# EAGLE design Robot_NI-alim (EAGLE 6.5.0)
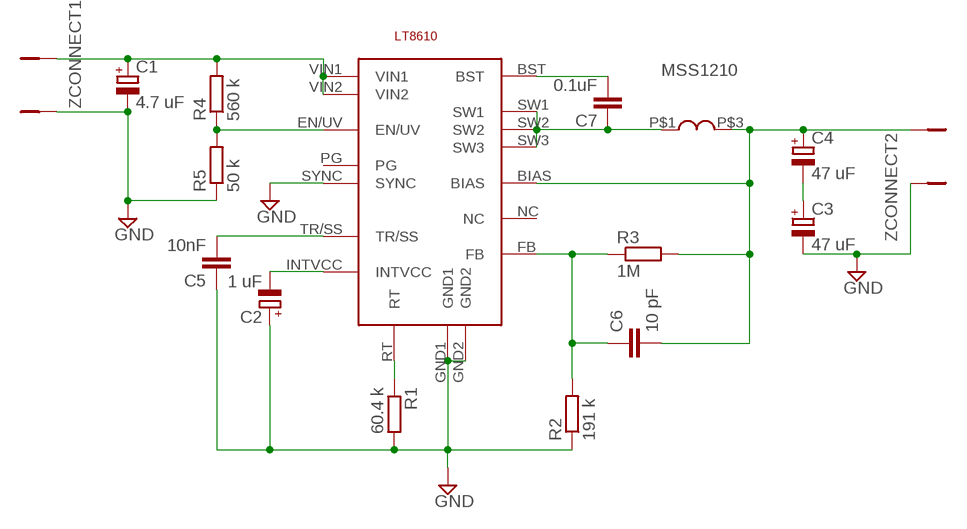
[diagram p0: schematic, sheet 1]

## Parts
C1  4.7 uF  C-POLTT5D7  [C-POL5MM]
C2  1 uF  C-POLTT5D7  [C-POL5MM]
C3  47 uF  C-POLTT5D7  [C-POL5MM]
C4  47 uF  C-POLTT5D7  [C-POL5MM]
C5  10nF  C-EUC0805  [C0805]
C6  10 pF  C-EUC0805  [C0805]
C7  0.1uF  C-EUC0805  [C0805]
R1  60.4 k  R-EU_R0805  [R0805]
R2  191 k  R-EU_R0805  [R0805]
R3  1M  R-EU_R0805  [R0805]
R4  560 k  R-EU_R0805  [R0805]
R5  50 k  R-EU_R0805  [R0805]
U$1  MSS1210  [MSS1210]
U$2  LT8610AC  [LT8610AC]
ZCONNECT1  LED5MM  [LED5MM]
ZCONNECT2  LED5MM  [LED5MM]

## Nets
GND: C1.- C2.+ C3.- C5.1 R1.2 R2.1 R5.1 U$2.GND1 U$2.GND2 U$2.SYNC ZCONNECT1.K(C) ZCONNECT2.A
N$1: C1.+ R4.2 U$2.VIN1 U$2.VIN2 ZCONNECT1.A
N$2: R4.1 R5.2 U$2.EN/UV
N$4: C5.2 U$2.TR/SS
N$5: C2.- U$2.INTVCC
N$6: C3.+ C4.-
N$7: R1.1 U$2.RT
N$9: C7.1 U$1.P$1 U$2.SW1 U$2.SW2 U$2.SW3
N$10: C7.2 U$2.BST
N$11: C4.+ C6.2 R3.2 U$1.P$3 U$2.BIAS ZCONNECT2.K(C)
N$12: C6.1 R2.2 R3.1 U$2.FB
Unconnected: U$2.NC U$2.PG

## Library data of the parts
C1-C4 = test3:C-POL: POLARIZED CAPACITOR, European symbol
C5-C7 = resistor:C-EU: CAPACITOR, European symbol
R1-R5 = rcl:R-EU_: RESISTOR, European symbol
U$1 = MSS1210:MSS1210
U$2 = lt8610ac:LT8610AC
ZCONNECT1 ZCONNECT2 = test3:LED: LED OSRAM: - CHIPLED LG R971, LG N971, LY N971, LG Q971, LY Q971, LO R971, LY R971 LH N974, LH R974 LS Q976, LO Q976, LY Q976 LO Q996 - Hyper CHIPLED LW Q18S LB Q993, LB Q99A, LB R99A - SideLED LS A670, LO A670, LY A670, LG A670, LP A670 LB A673, LV A673, LT A673, LW A673 LH A674 LY A675 LS A676, LA A676, LO A676, LY A676, LW A676 LS A679, LY A679, LG A679 - Hyper Micro SIDELED® LS Y876, LA Y876, LO Y876, LY Y876 LT Y87S - SmartLED LW L88C, LW L88S LB L89C, LB L89S, LG L890 LS L89K, LO L89K, LY L89K LS L896, LA L896, LO L896, LY L896 - TOPLED LS T670, LO T670, LY T670, LG T670, LP T670 LSG T670, LSP T670, LSY T670, LOP T670, LYG T670 LG T671, LOG T671, LSG T671 LB T673, LV T673, LT T673, LW T673 LH T674 LS T676, LA T676, LO T676, LY T676, LB T676, LH T676, LSB T676, LW T676 LB T67C, LV T67C, LT T67C, LS T67K, LO T67K, LY T67K, LW E67C LS E67B, LA E67B, LO E67B, LY E67B, LB E67C, LV E67C, LT E67C LW T67C LS T679, LY T679, LG T679 LS T770, LO T770, LY T770, LG T770, LP T770 LB T773, LV T773, LT T773, LW T773 LH T774 LS E675, LA E675, LY E675, LS T675 LS T776, LA T776, LO T776, LY T776, LB T776 LHGB T686 LT T68C, LB T68C - Hyper Mini TOPLED® LB M676 - Mini TOPLED Santana® LG M470 LS M47K, LO M47K, LY M47K Source: http://www.osram.convergy.de LUXEON: - LUMILED® LXK2-PW12-R00, LXK2-PW12-S00, LXK2-PW14-U00, LXK2-PW14-V00 LXK2-PM12-R00, LXK2-PM12-S00, LXK2-PM14-U00 LXK2-PE12-Q00, LXK2-PE12-R00, LXK2-PE12-S00, LXK2-PE14-T00, LXK2-PE14-U00 LXK2-PB12-K00, LXK2-PB12-L00, LXK2-PB12-M00, LXK2-PB14-N00, LXK2-PB14-P00, LXK2-PB14-Q00 LXK2-PR12-L00, LXK2-PR12-M00, LXK2-PR14-Q00, LXK2-PR14-R00 LXK2-PD12-Q00, LXK2-PD12-R00, LXK2-PD12-S00 LXK2-PH12-R00, LXK2-PH12-S00 LXK2-PL12-P00, LXK2-PL12-Q00, LXK2-PL12-R00 Source: www.luxeon.com KINGBRIGHT: KA-3528ASYC Source: www.kingbright.com

## Board
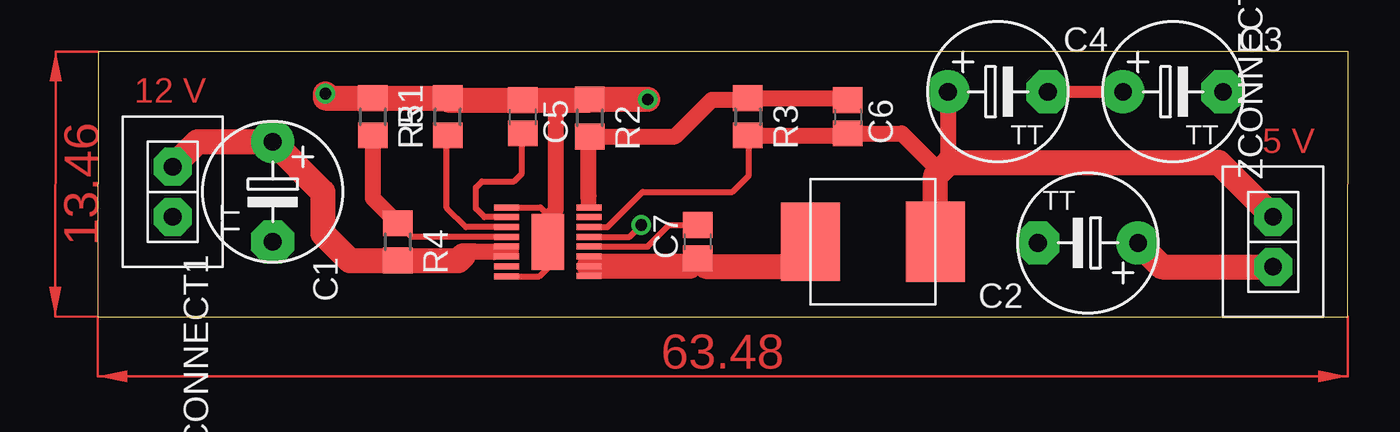
[diagram p1: board, top side]
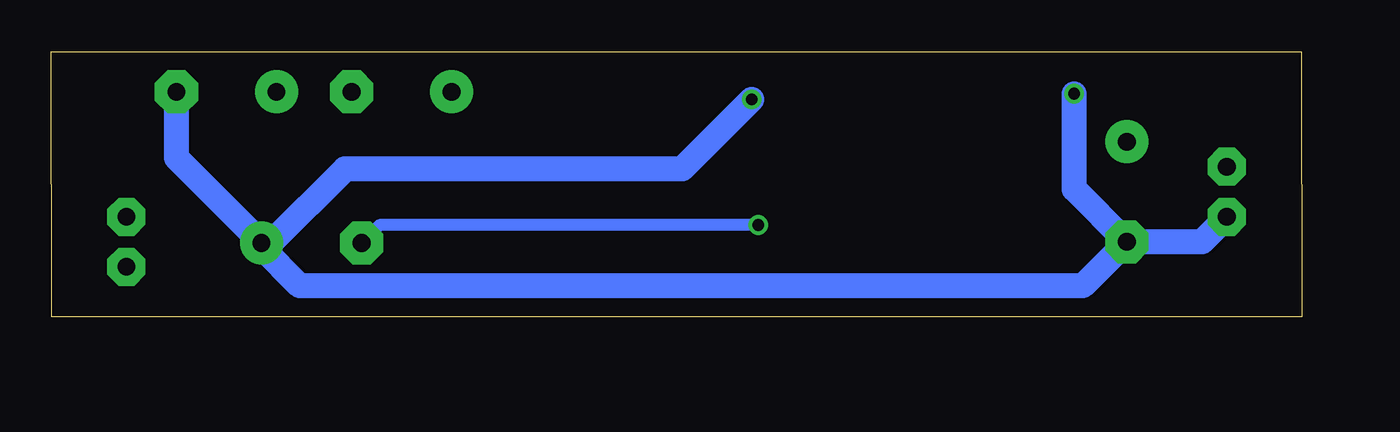
[diagram p2: board, bottom side, seen from below]

Size 63.52 x 13.46 mm. Coordinates in mm from the lower left corner, seen from the top.
Outline: 0,0 63.48,0 63.52,13.46 0.04,13.46 0,0
Copper layers (1*16): Top 0.035mm / dielectric 1.5mm / Bottom 0.035mm
Design rules "default": minimum track width 10mil, minimum drill 24mil, track to track 8mil, track to pad 8mil, pad to pad 8mil, via to via 8mil, smd to smd 8mil, copper to edge 40mil, drill to drill 8mil, minimum pad ring 10mil, minimum via ring 8mil, stop-mask expansion 4mil, vias tented up to drill 0mil, thermal gap 10mil

### Footprints (pad centres in the part's own frame; a part is rotated, then mirrored left to right if it is on the bottom)
C-POL5MM = drill 0.9 pad 2.184: + -2.54,0 | drill 0.9 pad 2.184 octagon: - 2.54,0
C0805 = smd 1.3 x 1.5: 1 -0.85,0; 2 0.85,0
R0805 = smd 1.3 x 1.5: 1 -0.95,0; 2 0.95,0
MSS1210 = smd 3 x 4: P$1 -3.175,0 | smd 3 x 4.08: P$3 3.175,0
LT8610AC = smd 1.27 x 0.305: BIAS 2.105,0.75; BST 2.105,-0.25; EN/UV -2.105,0.25; FB 2.105,1.75; GND1 -2.105,-1.75; INTVCC 2.105,0.25; NC -2.105,-1.25; PG 2.105,1.25; RT -2.105,0.75; SW1 2.105,-0.75; SW2 2.105,-1.25; SW3 2.105,-1.745; SYNC -2.105,1.75; TR/SS -2.105,1.25; VIN1 -2.105,-0.25; VIN2 -2.105,-0.75 | smd 1.651 x 2.845: GND2 0,0
LED5MM = drill 0.9 pad 1.93 octagon: A -1.27,0; K 1.27,0

### Placement (x,y rotation side)
C1  8.89,6.35 270 top
C2  50.29,3.75 180 top
C3  54.61,11.43 0 top
C4  45.72,11.43 0 top
C5  21.59,10.16 270 top
C6  38.1,10.16 270 top
C7  30.48,3.81 90 top
R1  17.78,10.16 90 top
R2  24.99,10.11 270 top
R3  33.02,10.16 270 top
R4  15.24,3.81 270 top
R5  13.97,10.16 270 top
U$1  39.37,3.81 0 top
U$2  22.86,3.81 0 top
ZCONNECT1  3.81,6.35 270 top
ZCONNECT2  59.69,3.81 90 top

### Tracks (layer width: path | path; a pad name or v marks a point on that pad's centre or on a via)
GND  (via drill 0.6)
  Top 0.305: U$2.SYNC 22.48,5.56 22.82,5.22 22.82,4.96 22.82,3.85 U$2.GND2 22.99,3.68 22.99,2.62 22.43,2.06 U$2.GND1
  Top 0.813: 25.07,11.06 23.6,11.06 23.25,10.71 23.25,5.38 22.82,4.96
  Top 1.27: C2.+ 54.04,2.54 ZCONNECT2.A | v11.56,11.33 11.56,11.11 R5.1 R1.2 17.78,11.01 C5.1 25.02,11.01 25.07,11.06 | R2.1 v27.93,11.05
  Bottom 1.27: C2.+ 57.15,8.07 C3.- | ZCONNECT1.K 5.08,3.81 C1.- | C1.- 11.12,1.57 50.88,1.57 52.83,3.52 C2.+ | C1.- 11.56,6.49 v11.56,11.33 | v27.93,11.05 31.48,7.51 48.59,7.51 52.35,3.75 C2.+
N$1
  Top 0.254: 20.2,3.3 20.43,3.06 U$2.VIN2 U$2.VIN1
  Top 0.813: 18.78,3.21 18.89,3.31 20.07,3.31 20.09,3.3 20.2,3.3
  Top 1.016: 18.57,3.11 18.67,3.21 18.78,3.21
  Top 1.27: ZCONNECT1.A 5.08,8.89 C1.+ 11.43,6.35 11.43,4.22 12.8,2.85 R4.2 18.32,2.86 18.57,3.11
N$2
  Top 0.305: U$2.EN/UV 15.94,4.06 R4.1
  Top 0.813: R5.2 13.97,6.03 R4.1
N$3
  Top 0.61: 20.54,3.29 21.09,3.29 21.09,3.3
N$4
  Top 0.305: U$2.TR/SS 19.64,5.06 19.21,5.5 19.21,6.57 19.52,6.88 21.14,6.88 21.55,7.29 21.55,9.27 C5.2
N$5  (via drill 0.6)
  Top 0.305: U$2.INTVCC 27.02,4.06 v27.61,4.66
  Bottom 0.61: v27.61,4.66 46.84,4.66 C2.-
N$6
  Top 0.61: C4.- C3.+
N$7
  Top 0.305: U$2.RT 18.7,4.56 17.73,5.54 17.73,9.16 R1.1
N$8
  Top 0.254: 19.2,3.59 18.65,3.59 18.65,3.58
N$9
  Top 0.254: U$2.SW3 U$2.SW2 U$2.SW1
  Top 1.27: U$2.SW2 30.08,2.56 C7.1 30.88,2.56 36.05,2.56 36.2,2.71 U$1.P$1
N$10
  Top 0.305: U$2.BST 27.93,3.56 29.02,4.65 C7.2
N$11
  Top 0.305: U$2.BIAS 25.89,4.56 27.68,6.34 32.23,6.34 33.07,7.18 33.07,9.16 R3.2
  Top 0.813: C4.+ 43.18,7.88 43.23,7.84 | 42.77,7.38 40.84,9.31 C6.2 38,9.21 R3.2
  Top 1.27: U$1.P$3 42.55,7.16 42.77,7.38 43.23,7.84 56.93,7.84 ZCONNECT2.K
N$12
  Top 0.254: 24.91,6.07 24.96,6.01 U$2.FB
  Top 0.813: C6.1 38,11.11 R3.1 32.94,11.03 31.19,11.03 29.32,9.15 R2.2 24.91,9.07 24.91,6.07
N$13
  Top 0.254: 24.69,5.6 24.67,5.6 24.67,6.01
N$14
  Top 0.254: 25.24,5.59 25.21,5.59 25.21,6.13
(copper drawn outside any net)
  shapes: Top area x2

### Text on the board
Top: 12 V | 5 V